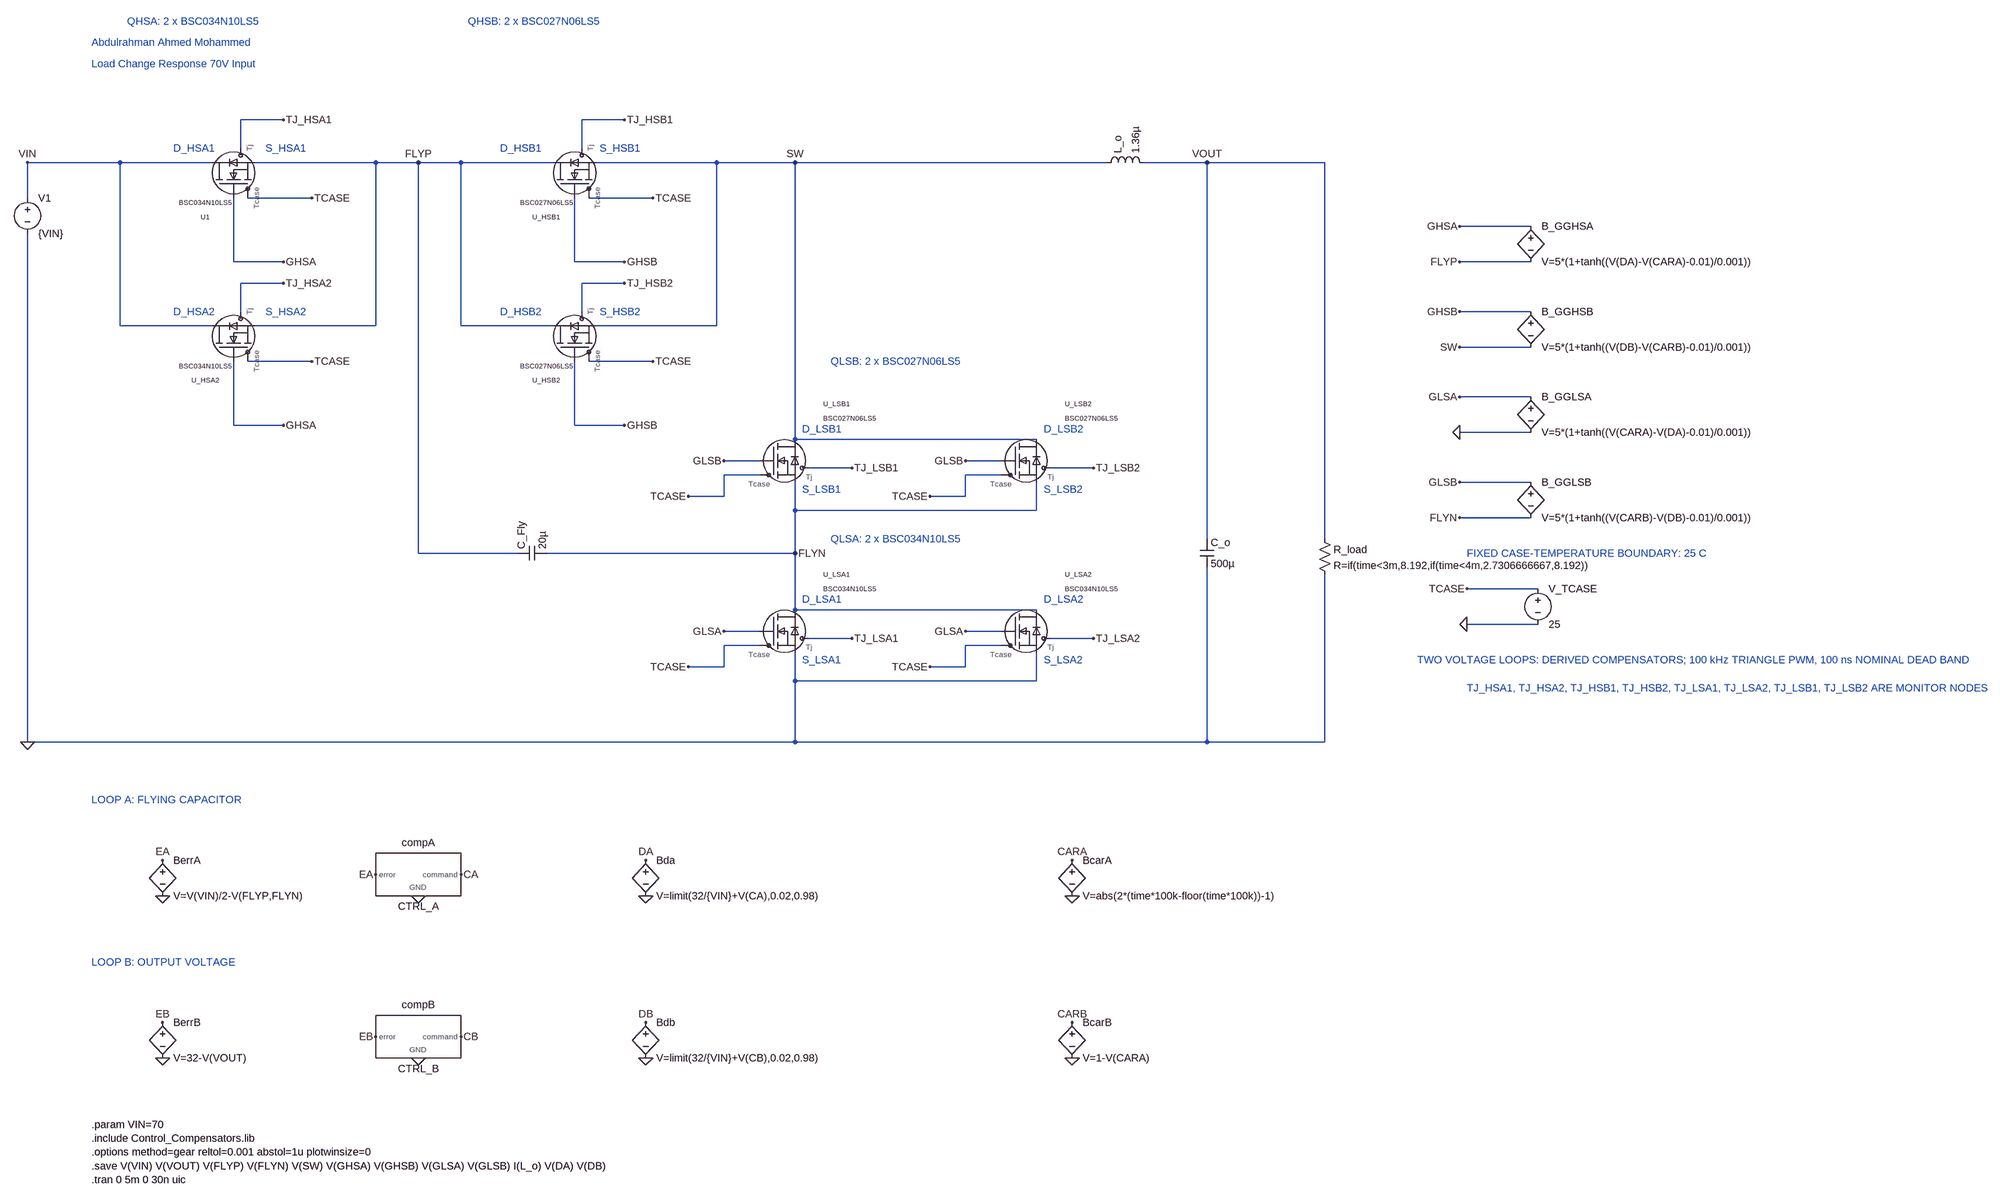
[diagram p0: schematic Load_Change_Response_70V_Input.asc]
Load_Change_Response_70V_Input.asc, the LTspice schematic file:
Version 4.1
SHEET 1 5200 3000
WIRE 592 -16 496 -16
WIRE 1360 -16 1264 -16
WIRE 496 48 496 -16
WIRE 1264 48 1264 -16
WIRE 224 80 16 80
WIRE 432 80 224 80
WIRE 800 80 528 80
WIRE 896 80 800 80
WIRE 992 80 896 80
WIRE 1200 80 992 80
WIRE 1568 80 1296 80
WIRE 1744 80 1568 80
WIRE 2448 80 1744 80
WIRE 2672 80 2528 80
WIRE 2992 80 2672 80
WIRE 16 160 16 80
WIRE 656 160 512 160
WIRE 1424 160 1280 160
WIRE 3456 224 3296 224
WIRE 480 304 480 160
WIRE 592 304 480 304
WIRE 1248 304 1248 160
WIRE 1360 304 1248 304
WIRE 3456 304 3296 304
WIRE 592 352 496 352
WIRE 1360 352 1264 352
WIRE 496 416 496 352
WIRE 1264 416 1264 352
WIRE 3456 416 3296 416
WIRE 224 448 224 80
WIRE 432 448 224 448
WIRE 800 448 800 80
WIRE 800 448 528 448
WIRE 992 448 992 80
WIRE 1200 448 992 448
WIRE 1568 448 1568 80
WIRE 1568 448 1296 448
WIRE 3456 496 3296 496
WIRE 656 528 512 528
WIRE 1424 528 1280 528
WIRE 3456 608 3296 608
WIRE 480 672 480 528
WIRE 592 672 480 672
WIRE 1248 672 1248 528
WIRE 1360 672 1248 672
WIRE 3456 688 3296 688
WIRE 1744 704 1744 80
WIRE 2288 704 1744 704
WIRE 1664 752 1584 752
WIRE 2208 752 2128 752
WIRE 1872 768 1776 768
WIRE 2416 768 2320 768
WIRE 1664 784 1584 784
WIRE 2208 784 2128 784
WIRE 3456 800 3296 800
WIRE 1584 832 1584 784
WIRE 1584 832 1504 832
WIRE 2128 832 2128 784
WIRE 2128 832 2048 832
WIRE 1744 864 1744 800
WIRE 2288 864 2288 800
WIRE 2288 864 1744 864
WIRE 3456 880 3296 880
WIRE 2672 928 2672 80
WIRE 2992 928 2992 80
WIRE 896 960 896 80
WIRE 1120 960 896 960
WIRE 1744 960 1744 864
WIRE 1744 960 1184 960
WIRE 3472 1040 3312 1040
WIRE 1744 1088 1744 960
WIRE 2288 1088 1744 1088
WIRE 3472 1120 3312 1120
WIRE 1664 1136 1584 1136
WIRE 2208 1136 2128 1136
WIRE 1872 1152 1776 1152
WIRE 2416 1152 2320 1152
WIRE 1664 1168 1584 1168
WIRE 2208 1168 2128 1168
WIRE 1584 1216 1584 1168
WIRE 1584 1216 1504 1216
WIRE 2128 1216 2128 1168
WIRE 2128 1216 2048 1216
WIRE 1744 1248 1744 1184
WIRE 2288 1248 2288 1184
WIRE 2288 1248 1744 1248
WIRE 16 1424 16 240
WIRE 1744 1424 1744 1248
WIRE 1744 1424 16 1424
WIRE 2672 1424 2672 992
WIRE 2672 1424 1744 1424
WIRE 2992 1424 2992 1008
WIRE 2992 1424 2672 1424
FLAG 16 1424 0
FLAG 16 80 VIN
FLAG 592 304 GHSA
FLAG 656 160 TCASE
FLAG 592 -16 TJ_HSA1
FLAG 592 672 GHSA
FLAG 656 528 TCASE
FLAG 592 352 TJ_HSA2
FLAG 1360 304 GHSB
FLAG 1424 160 TCASE
FLAG 1360 -16 TJ_HSB1
FLAG 1360 672 GHSB
FLAG 1424 528 TCASE
FLAG 1360 352 TJ_HSB2
FLAG 896 80 FLYP
FLAG 1744 80 SW
FLAG 1584 752 GLSB
FLAG 1504 832 TCASE
FLAG 1872 768 TJ_LSB1
FLAG 2128 752 GLSB
FLAG 2048 832 TCASE
FLAG 2416 768 TJ_LSB2
FLAG 1584 1136 GLSA
FLAG 1504 1216 TCASE
FLAG 1872 1152 TJ_LSA1
FLAG 2128 1136 GLSA
FLAG 2048 1216 TCASE
FLAG 2416 1152 TJ_LSA2
FLAG 1744 960 FLYN
FLAG 2672 80 VOUT
FLAG 3296 224 GHSA
FLAG 3296 304 FLYP
FLAG 3296 416 GHSB
FLAG 3296 496 SW
FLAG 3296 608 GLSA
FLAG 3296 688 0
FLAG 3296 800 GLSB
FLAG 3296 880 FLYN
FLAG 3312 1040 TCASE
FLAG 3312 1120 0
SYMBOL voltage 16 144 R0
SYMATTR InstName V1
SYMATTR Value {VIN}
SYMBOL BSC034N10LS5 480 112 R270
WINDOW 0 -80 -64 VBottom 1
WINDOW 38 -48 -64 VBottom 1
SYMATTR InstName U1
SYMBOL BSC034N10LS5 480 480 R270
WINDOW 0 -80 -64 VBottom 1
WINDOW 38 -48 -64 VBottom 1
SYMATTR InstName U_HSA2
SYMBOL BSC027N06LS5 1248 112 R270
WINDOW 0 -80 -64 VBottom 1
WINDOW 38 -48 -64 VBottom 1
SYMATTR InstName U_HSB1
SYMBOL BSC027N06LS5 1248 480 R270
WINDOW 0 -80 -64 VBottom 1
WINDOW 38 -48 -64 VBottom 1
SYMATTR InstName U_HSB2
SYMBOL BSC027N06LS5 1712 752 R0
WINDOW 0 96 -128 Left 1
WINDOW 38 96 -96 Left 1
SYMATTR InstName U_LSB1
SYMBOL BSC027N06LS5 2256 752 R0
WINDOW 0 96 -128 Left 1
WINDOW 38 96 -96 Left 1
SYMATTR InstName U_LSB2
SYMBOL BSC034N10LS5 1712 1136 R0
WINDOW 0 96 -128 Left 1
WINDOW 38 96 -96 Left 1
SYMATTR InstName U_LSA1
SYMBOL BSC034N10LS5 2256 1136 R0
WINDOW 0 96 -128 Left 1
WINDOW 38 96 -96 Left 1
SYMATTR InstName U_LSA2
SYMBOL cap 1120 976 R270
SYMATTR SpiceLine Rser=3m
SYMATTR InstName C_Fly
SYMATTR Value 20µ
SYMATTR SpiceLine2 IC=35.0
SYMBOL ind 2432 96 R270
SYMATTR InstName L_o
SYMATTR Value 1.36µ
SYMATTR SpiceLine IC=3.90625
SYMBOL cap 2656 928 R0
SYMATTR SpiceLine Rser=13m
SYMATTR InstName C_o
SYMATTR Value 500µ
SYMATTR SpiceLine2 IC=32
SYMBOL res 2976 912 R0
SYMATTR InstName R_load
SYMATTR Value R=if(time<3m,8.192,if(time<4m,2.7306666667,8.192))
SYMBOL bv 3456 208 R0
SYMATTR InstName B_GGHSA
SYMATTR Value V=5*(1+tanh((V(DA)-V(CARA)-0.01)/0.001))
SYMBOL bv 3456 400 R0
SYMATTR InstName B_GGHSB
SYMATTR Value V=5*(1+tanh((V(DB)-V(CARB)-0.01)/0.001))
SYMBOL bv 3456 592 R0
SYMATTR InstName B_GGLSA
SYMATTR Value V=5*(1+tanh((V(CARA)-V(DA)-0.01)/0.001))
SYMBOL bv 3456 784 R0
SYMATTR InstName B_GGLSB
SYMATTR Value V=5*(1+tanh((V(CARB)-V(DB)-0.01)/0.001))
SYMBOL voltage 3472 1024 R0
SYMATTR InstName V_TCASE
SYMATTR Value 25
TEXT 240 -240 Left 2 ;QHSA: 2 x BSC034N10LS5
TEXT 1008 -240 Left 2 ;QHSB: 2 x BSC027N06LS5
TEXT 1824 528 Left 2 ;QLSB: 2 x BSC027N06LS5
TEXT 1824 928 Left 2 ;QLSA: 2 x BSC034N10LS5
TEXT 344 48 Left 2 ;D_HSA1
TEXT 552 48 Left 2 ;S_HSA1
TEXT 344 416 Left 2 ;D_HSA2
TEXT 552 416 Left 2 ;S_HSA2
TEXT 1080 48 Left 2 ;D_HSB1
TEXT 1304 48 Left 2 ;S_HSB1
TEXT 1080 416 Left 2 ;D_HSB2
TEXT 1304 416 Left 2 ;S_HSB2
TEXT 1760 680 Left 2 ;D_LSB1
TEXT 1760 816 Left 2 ;S_LSB1
TEXT 2304 680 Left 2 ;D_LSB2
TEXT 2304 816 Left 2 ;S_LSB2
TEXT 1760 1064 Left 2 ;D_LSA1
TEXT 1760 1200 Left 2 ;S_LSA1
TEXT 2304 1064 Left 2 ;D_LSA2
TEXT 2304 1200 Left 2 ;S_LSA2
TEXT 3312 960 Left 2 ;FIXED CASE-TEMPERATURE BOUNDARY: 25 C
TEXT 3312 1264 Left 2 ;TJ_HSA1, TJ_HSA2, TJ_HSB1, TJ_HSB2, TJ_LSA1, TJ_LSA2, TJ_LSB1, TJ_LSB2 ARE MONITOR NODES
TEXT 3200 1200 Left 2 ;TWO VOLTAGE LOOPS: DERIVED COMPENSATORS; 100 kHz TRIANGLE PWM, 100 ns NOMINAL DEAD BAND
TEXT 160 1784 Left 2 ;LOOP A: FLYING CAPACITOR
SYMBOL bv 320 1904 R0
SYMATTR InstName BerrA
SYMATTR Value V=V(VIN)/2-V(FLYP,FLYN)
FLAG 320 1920 EA
FLAG 320 2000 0
SYMBOL bv 1408 1904 R0
SYMATTR InstName Bda
SYMATTR Value V=limit(32/{VIN}+V(CA),0.02,0.98)
FLAG 1408 1920 DA
FLAG 1408 2000 0
SYMBOL bv 2368 1904 R0
SYMATTR InstName BcarA
SYMATTR Value V=abs(2*(time*100k-floor(time*100k))-1)
FLAG 2368 1920 CARA
FLAG 2368 2000 0
SYMBOL Compensator 800 1904 R0
SYMATTR InstName compA
SYMATTR Value CTRL_A
FLAG 800 1952 EA
FLAG 992 1952 CA
FLAG 896 2000 0
TEXT 160 2296 Left 2 ;LOOP B: OUTPUT VOLTAGE
SYMBOL bv 320 2416 R0
SYMATTR InstName BerrB
SYMATTR Value V=32-V(VOUT)
FLAG 320 2432 EB
FLAG 320 2512 0
SYMBOL bv 1408 2416 R0
SYMATTR InstName Bdb
SYMATTR Value V=limit(32/{VIN}+V(CB),0.02,0.98)
FLAG 1408 2432 DB
FLAG 1408 2512 0
SYMBOL bv 2368 2416 R0
SYMATTR InstName BcarB
SYMATTR Value V=1-V(CARA)
FLAG 2368 2432 CARB
FLAG 2368 2512 0
SYMBOL Compensator 800 2416 R0
SYMATTR InstName compB
SYMATTR Value CTRL_B
FLAG 800 2464 EB
FLAG 992 2464 CB
FLAG 896 2512 0
TEXT 160 2880 Left 2 !.param VIN=70\n.include Control_Compensators.lib\n.options method=gear reltol=0.001 abstol=1u plotwinsize=0\n.save V(VIN) V(VOUT) V(FLYP) V(FLYN) V(SW) V(GHSA) V(GHSB) V(GLSA) V(GLSB) I(L_o) V(DA) V(DB)\n.tran 0 5m 0 30n uic

TEXT 160 -192 Left 2 ;Abdulrahman Ahmed Mohammed
TEXT 160 -144 Left 2 ;Load Change Response 70V Input

The netlist it stands for:
* Load_Change_Response_70V_Input.asc
V1 VIN 0 {VIN}
X§U1 VIN GHSA FLYP TJ_HSA1 TCASE BSC034N10LS5  ; pins drain gate source Tj Tcase
X§U_HSA2 VIN GHSA FLYP TJ_HSA2 TCASE BSC034N10LS5  ; pins drain gate source Tj Tcase
X§U_HSB1 FLYP GHSB SW TJ_HSB1 TCASE BSC027N06LS5  ; pins drain gate source Tj Tcase
X§U_HSB2 FLYP GHSB SW TJ_HSB2 TCASE BSC027N06LS5  ; pins drain gate source Tj Tcase
X§U_LSB1 SW GLSB FLYN TJ_LSB1 TCASE BSC027N06LS5  ; pins drain gate source Tj Tcase
X§U_LSB2 SW GLSB FLYN TJ_LSB2 TCASE BSC027N06LS5  ; pins drain gate source Tj Tcase
X§U_LSA1 FLYN GLSA 0 TJ_LSA1 TCASE BSC034N10LS5  ; pins drain gate source Tj Tcase
X§U_LSA2 FLYN GLSA 0 TJ_LSA2 TCASE BSC034N10LS5  ; pins drain gate source Tj Tcase
C_Fly FLYP FLYN 20µ Rser=3m IC=35.0
L_o SW VOUT 1.36µ IC=3.90625
C_o VOUT 0 500µ Rser=13m IC=32
R_load VOUT 0 R=if(time<3m,8.192,if(time<4m,2.7306666667,8.192))
B_GGHSA GHSA FLYP V=5*(1+tanh((V(DA)-V(CARA)-0.01)/0.001))
B_GGHSB GHSB SW V=5*(1+tanh((V(DB)-V(CARB)-0.01)/0.001))
B_GGLSA GLSA 0 V=5*(1+tanh((V(CARA)-V(DA)-0.01)/0.001))
B_GGLSB GLSB FLYN V=5*(1+tanh((V(CARB)-V(DB)-0.01)/0.001))
V_TCASE TCASE 0 25
BerrA EA 0 V=V(VIN)/2-V(FLYP,FLYN)
Bda DA 0 V=limit(32/{VIN}+V(CA),0.02,0.98)
BcarA CARA 0 V=abs(2*(time*100k-floor(time*100k))-1)
X§compA EA CA 0 CTRL_A  ; pins error command GND
BerrB EB 0 V=32-V(VOUT)
Bdb DB 0 V=limit(32/{VIN}+V(CB),0.02,0.98)
BcarB CARB 0 V=1-V(CARA)
X§compB EB CB 0 CTRL_B  ; pins error command GND
* QHSA: 2 x BSC034N10LS5
* QHSB: 2 x BSC027N06LS5
* QLSB: 2 x BSC027N06LS5
* QLSA: 2 x BSC034N10LS5
* D_HSA1
* S_HSA1
* D_HSA2
* S_HSA2
* D_HSB1
* S_HSB1
* D_HSB2
* S_HSB2
* D_LSB1
* S_LSB1
* D_LSB2
* S_LSB2
* D_LSA1
* S_LSA1
* D_LSA2
* S_LSA2
* FIXED CASE-TEMPERATURE BOUNDARY: 25 C
* TJ_HSA1, TJ_HSA2, TJ_HSB1, TJ_HSB2, TJ_LSA1, TJ_LSA2, TJ_LSB1, TJ_LSB2 ARE MONITOR NODES
* TWO VOLTAGE LOOPS: DERIVED COMPENSATORS; 100 kHz TRIANGLE PWM, 100 ns NOMINAL DEAD BAND
* LOOP A: FLYING CAPACITOR
* LOOP B: OUTPUT VOLTAGE
.param VIN=70
.include Control_Compensators.lib
.options method=gear reltol=0.001 abstol=1u plotwinsize=0
.save V(VIN) V(VOUT) V(FLYP) V(FLYN) V(SW) V(GHSA) V(GHSB) V(GLSA) V(GLSB) I(L_o) V(DA) V(DB)
.tran 0 5m 0 30n uic
* Abdulrahman Ahmed Mohammed
* Load Change Response 70V Input
.lib OptiMOS5_100V_LTSpice.lib
.lib OptiMOS_OptiMOS5_60V_LTSpice.lib
.backanno
.end